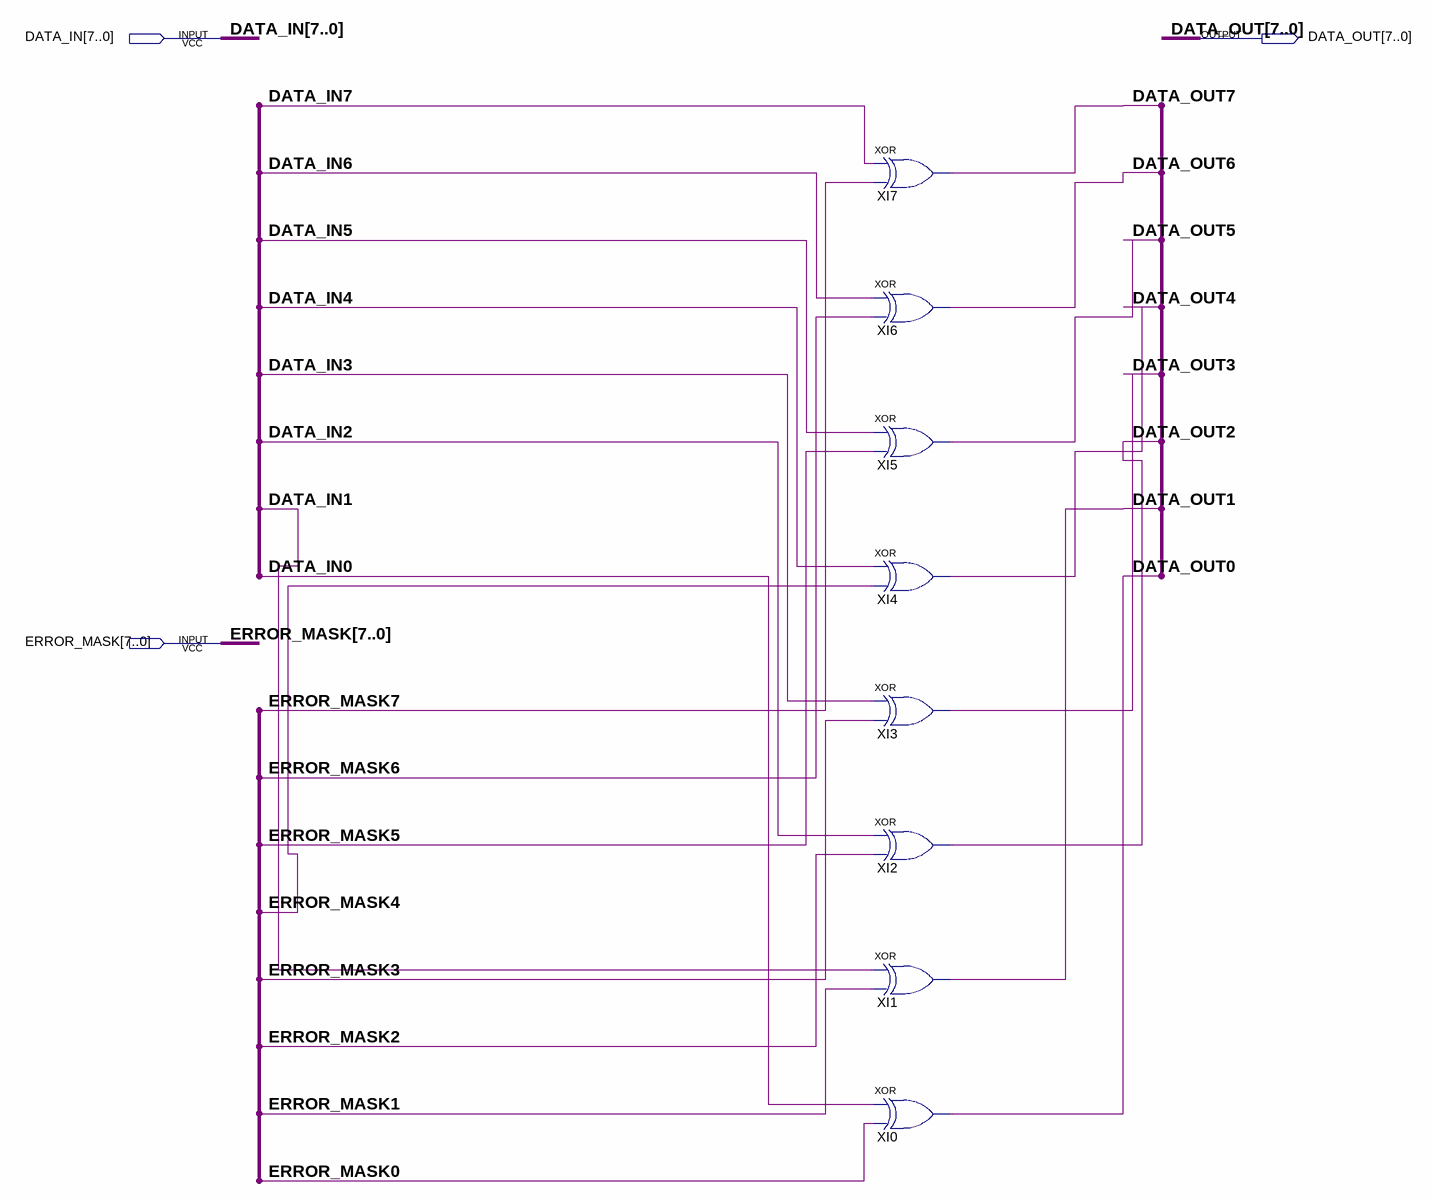
[diagram p0: schematic sheet]
// Quartus schematic error_injector.bdf as structural Verilog: 8 symbols, 3 pins
module error_injector (
  input  [7:0] DATA_IN,
  input  [7:0] ERROR_MASK,
  output [7:0] DATA_OUT
);

  xor XI7 (DATA_OUT[7], DATA_IN[7], ERROR_MASK[7]);
  xor XI6 (DATA_OUT[6], DATA_IN[6], ERROR_MASK[6]);
  xor XI5 (DATA_OUT[5], DATA_IN[5], ERROR_MASK[5]);
  xor XI4 (DATA_OUT[4], DATA_IN[4], ERROR_MASK[4]);
  xor XI3 (DATA_OUT[3], DATA_IN[3], ERROR_MASK[3]);
  xor XI2 (DATA_OUT[2], DATA_IN[2], ERROR_MASK[2]);
  xor XI1 (DATA_OUT[1], DATA_IN[1], ERROR_MASK[1]);
  xor XI0 (DATA_OUT[0], DATA_IN[0], ERROR_MASK[0]);
endmodule
